# Altium schematic sheet 01_Input_Protection.SchDoc
size 431 x 279 mm; SheetNumber: 1; SheetTotal: 1
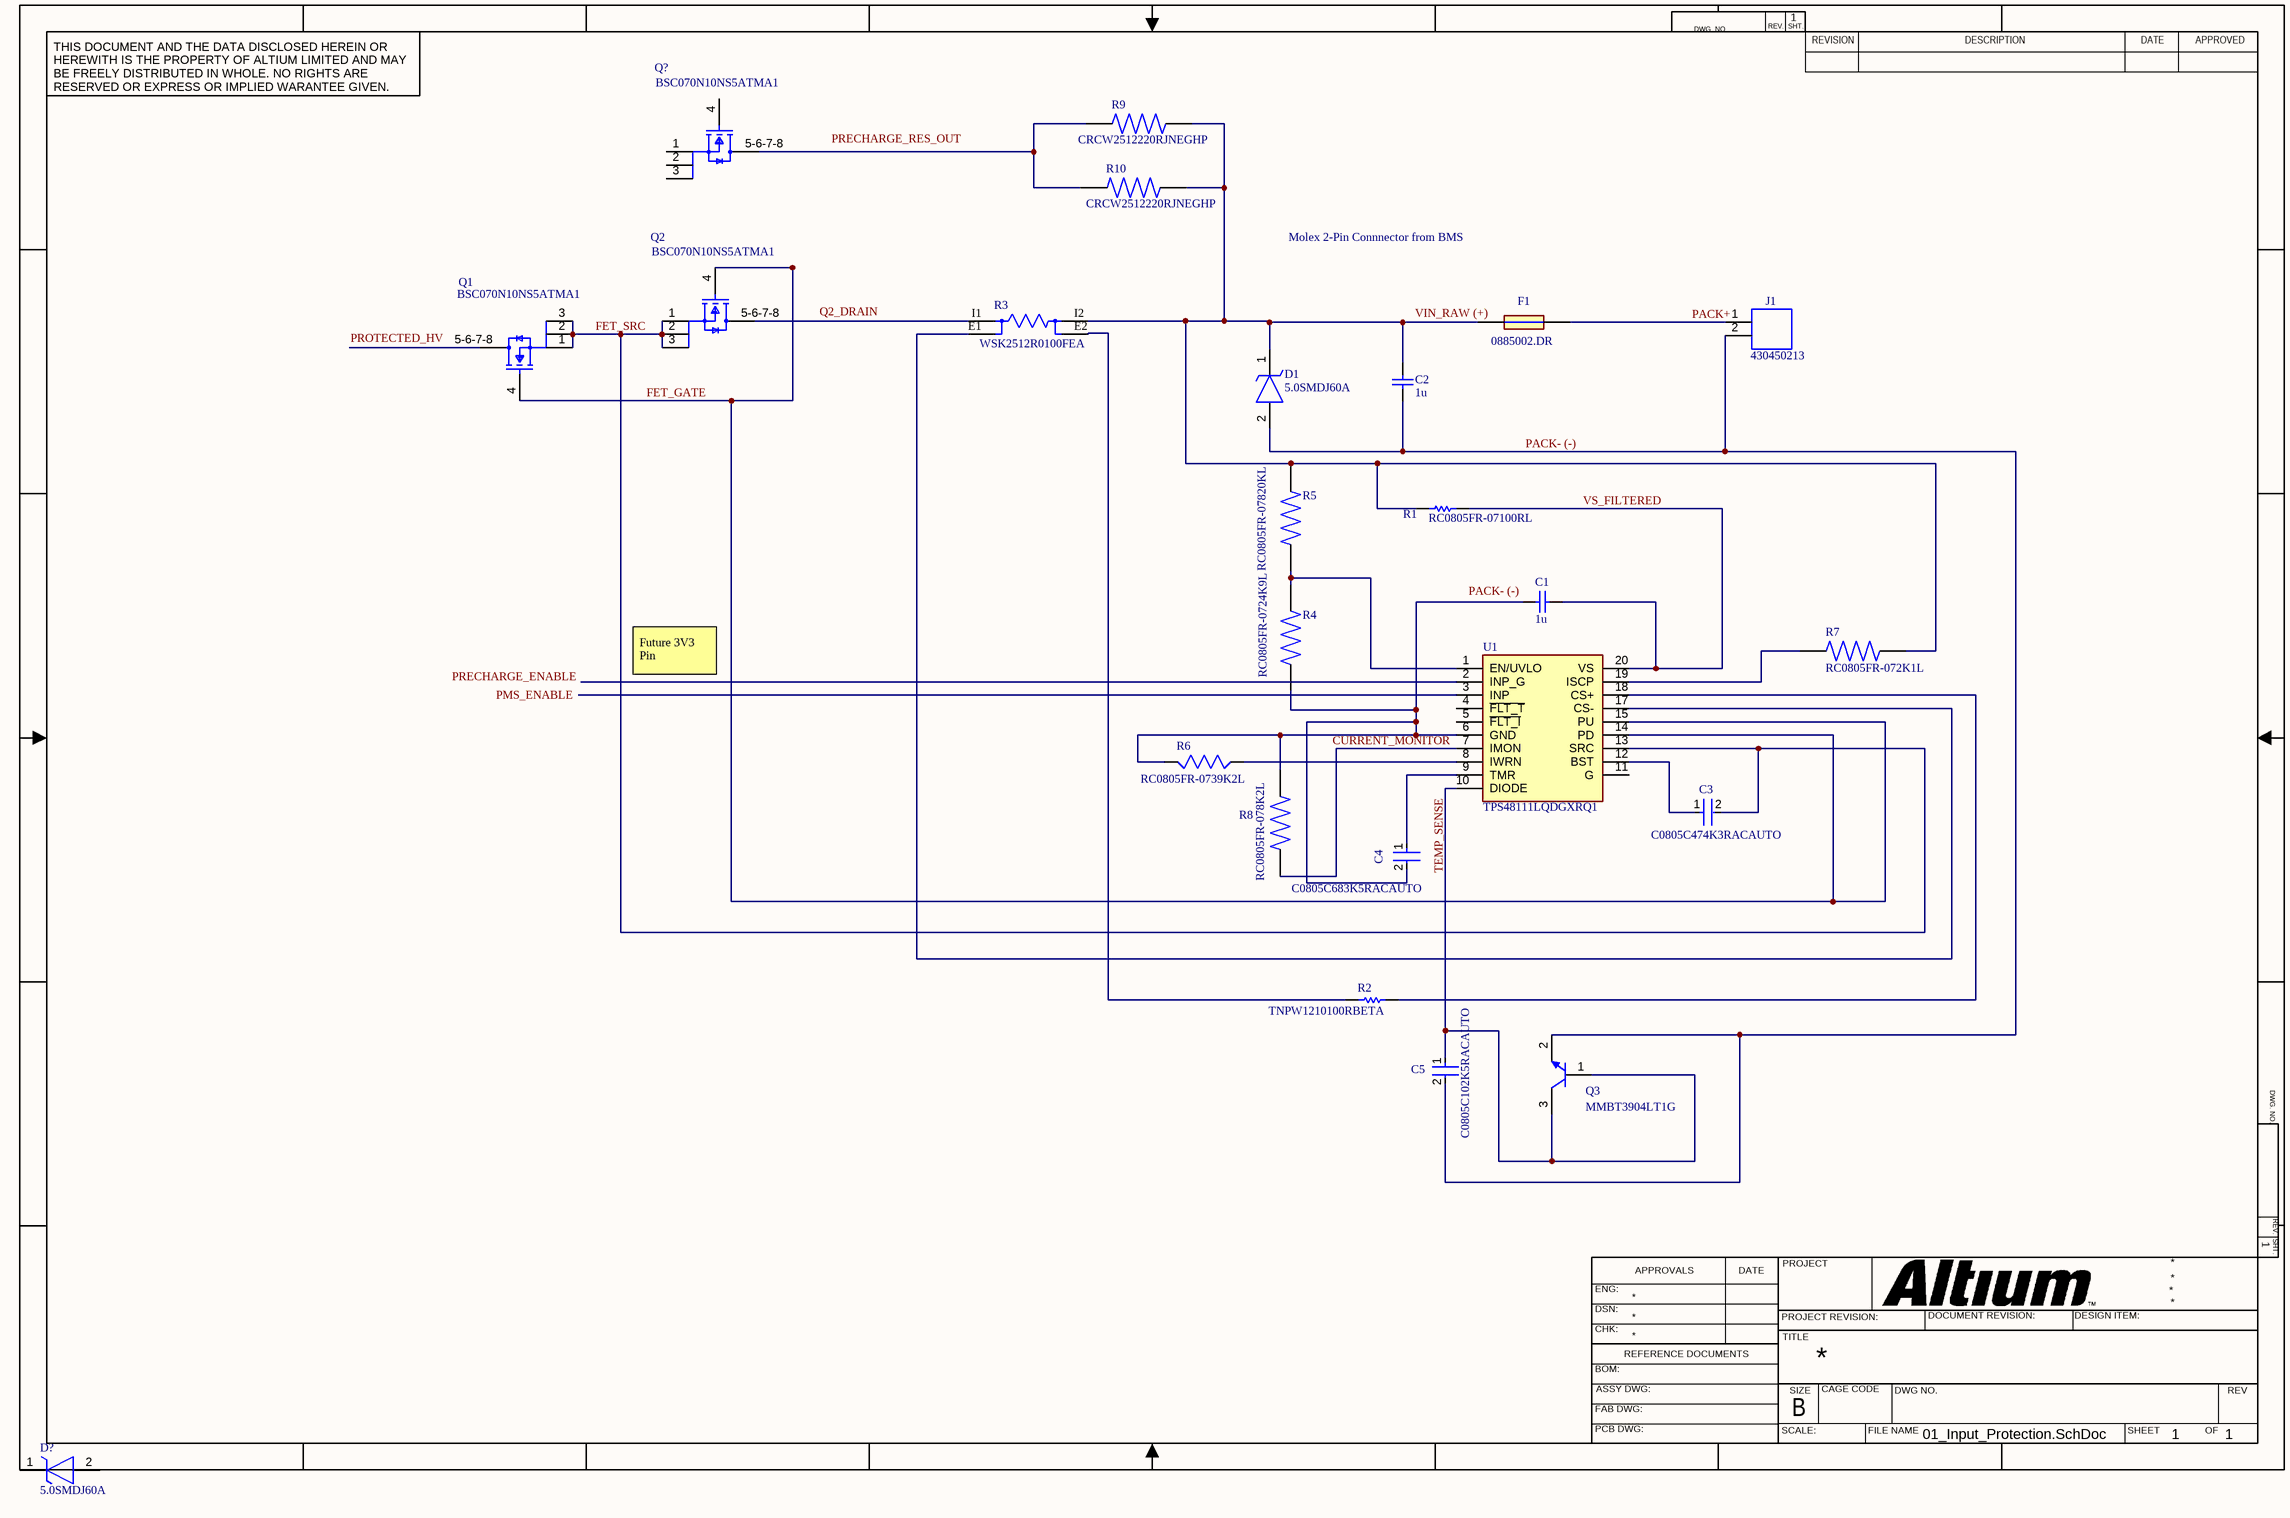
[diagram p0: 01_Input_Protection.SchDoc]

## Parts
C1  value 1u  (hidden comment: Capacitor)
C2  value 1u  (hidden comment: Capacitor)
C3  C0805C474K3RACAUTO  [FP-C0805C-DN-MFG]
C4  C0805C683K5RACAUTO  [FP-C0805C-DN-MFG]
C5  C0805C102K5RACAUTO  [FP-C0805C-DN-MFG]
D1  5.0SMDJ60A  [DIOM7959X262N]
D?  5.0SMDJ60A  [DIOM7959X262N]
F1  0885002.DR  [FUSC10948X488N]
J1  430450213  [CONN_SD-43045-005_02_MOL]
Q1  BSC070N10NS5ATMA1  [FP-PG-TDSON-8-MFG]
Q2  BSC070N10NS5ATMA1  [FP-PG-TDSON-8-MFG]
Q3  MMBT3904LT1G  [ONSC-SOT-23-3-318-08_V]
Q?  BSC070N10NS5ATMA1  [FP-PG-TDSON-8-MFG]
R1  RC0805FR-07100RL  [RESC2013X60X35ML10T20]
R2  TNPW1210100RBETA  [RESC3225X75X50NL15T25]
R3  WSK2512R0100FEA  [FP-WSK2512-1_19-MFG]
R4  RC0805FR-0724K9L  [RESC2012X60N]
R5  RC0805FR-07820KL  [RESC2012X60N]
R6  RC0805FR-0739K2L  [RESC2012X60]
R7  RC0805FR-072K1L  [RESC2012X60N]
R8  RC0805FR-078K2L  [RESC2012X60N]
R9  CRCW2512220RJNEGHP  [RESC6331X70N]
R10  CRCW2512220RJNEGHP  [RESC6331X70N]
U1  TPS48111LQDGXRQ1  [TPS48111LQDGXRQ1]

## Nets
FET_GATE: Q1.4(G) Q2.4(G) U1.14(PD) U1.15(PU)
FET_SRC: C3.2 Q1.1(S) Q1.2(S) Q1.3(S) Q2.1(S) Q2.2(S) Q2.3(S) U1.13(SRC)
PACK+: F1.2 J1.1
PACK- (-): C2.2 C5.2 D1.2(A) J1.2 Q3.2(E)
VS_FILTERED: C1.1 R1.2 U1.20(VS)
NetC1_2: C1.2 C4.2 R4.1 R6.1 R8.2 U1.6(GND)
NetC2_1: C2.1 D1.1(K) F1.1 R1.1 R3.I2 R5.2 R7.2 R9.2 R10.2
NetC3_1: C3.1 U1.12(BST)
NetC4_1: C4.1 U1.9(TMR)
NetC5_1: C5.1 Q3.1(B) Q3.3(C) U1.10(DIODE)
NetQ2_5-6-7-8: Q2.5-6-7-8(D) R3.I1
NetQ?_5-6-7-8: Q?.5-6-7-8(D) R9.1 R10.1
NetR2_1: R2.1 R3.E2
NetR2_2: R2.2 U1.18(CS+)
NetR3_E1: R3.E1 U1.17(CS-)
NetR4_2: R4.2 R5.1 U1.1(EN/UVLO)
NetR6_2: R6.2 U1.8(IWRN)
NetR7_1: R7.1 U1.19(ISCP)
NetR8_1: R8.1 U1.7(IMON)

Not connected (* = marked no-connect by the designer): D? 1(K) 2(A); Q1 5-6-7-8(D); Q? 1(S) 2(S) 3(S) 4(G); U1 2(INP_G) 3(INP) 4(~{FLT_T}) 5(~{FLT_I}) 11(G)

## Notes on the sheet
- Molex 2-Pin Connnector from BMS
- Future 3V3 Pin
- Labels drawn without touching a wire or pin: CURRENT_MONITOR, PACK- (-), PMS_ENABLE, PRECHARGE_ENABLE, PRECHARGE_RES_OUT, PROTECTED_HV, Q2_DRAIN, TEMP_SENSE, VIN_RAW (+)
- DWG. NO.
- REV.
- SHT.
- THIS DOCUMENT AND THE DATA DISCLOSED HEREIN OR HEREWITH IS THE PROPERTY OF ALTIUM LIMITED AND MAY BE FREELY DISTRIBUTED IN WHOLE. NO RIGHTS ARE RESERVED OR EXPRESS OR IMPLIED WARANTEE GIVEN.
- REVISION
- DESCRIPTION
- DATE
- APPROVED
- ENG:
- APPROVALS
- PROJECT
- DSN:
- CHK:
- REFERENCE DOCUMENTS
- PROJECT REVISION:
- TITLE
- DOCUMENT REVISION:
- DESIGN ITEM:
- BOM:
- FAB DWG:
- PCB DWG:
- ASSY DWG:
- SCALE:
- SIZE
- B
- CAGE CODE
- FILE NAME
- DWG NO.
- SHEET
- OF
- REV

## Library data of the parts
C1 C2 = Capacitor: SimulationGenericComponent: True
C3 = CMP-2007-01171-2: CAP CER 0.47UF 25V X7R 0805; Manufacturer: KEMET; Tolerance: 0.1; Material: Ceramic; Value: 0.47 μF; Temperature Coefficient: 30ppm/°C; Device Class L1: Passive Components; Temperature Range Low: -55°C; Digikey Description: CAP CER 0.47UF 25V X7R 0805; Height: 0.88mm; Temperature: -55°C to +125°C; Temperature Characteristic: X7R; Category: Cap; Ipc Land Pattern Name: CAPC200125X78; ComponentLink2URL: https://content.kemet.com/datasheets/KEM_C1003_C0G_SMD.pdf; Lead Free: Yes; Temperature Range High: +125°C; Octopart: https://octopart.com/c0805c474k3racauto-kemet-20068703; Manufacturer Part Number: C0805C474K3RACAUTO; RoHS: TRUE; Package: C0805C-DN; Capacitance: 0.47 μF; Device Class L2: Capacitors; Voltage Rating: 25 V; Automotive: No; Mouser Description: Multilayer Ceramic Capacitors MLCC - SMD/SMT 0.47uF 25volts 10% X7R AUTO; Device Class L3: Ceramic Capacitors; ComponentLink2Description: Datasheet
C4 = CMP-2007-01070-2: CAP CER 0.068UF 50V X7R 0805; Manufacturer: KEMET; Material: Ceramic; Capacitance: 68,000 pF; Value: 68,000 pF; Tolerance: 0.1; Temperature Coefficient: 30ppm/°C; Voltage Rating: 50 V; Temperature Characteristic: X7R; Category: Cap; Automotive: No; ComponentLink2Description: Datasheet; Temperature: -55°C to +125°C; ComponentLink2URL: https://content.kemet.com/datasheets/KEM_C1003_C0G_SMD.pdf; Lead Free: Yes; Octopart: https://octopart.com/c0805c683k5racauto-kemet-12557840; Device Class L3: Ceramic Capacitors; Digikey Description: CAP CER 0.068UF 50V X7R 0805; Ipc Land Pattern Name: CAPC200125X78; Temperature Range Low: -55°C; Device Class L1: Passive Components; Height: 0.88mm; Temperature Range High: +125°C; Device Class L2: Capacitors; Manufacturer Part Number: C0805C683K5RACAUTO; Package: C0805C-DN; RoHS: TRUE
C5 = CMP-2007-00243-2: CAP CER 1000PF 50V X7R 0805; Manufacturer: KEMET; Temperature Coefficient: 30ppm/°C; Description: C0805 1,000 pF X7R 30ppm/°C 10.00% 50 V; Capacitance: 1,000 pF; Value: 1,000 pF; Tolerance: 0.1; Material: Ceramic; Temperature: -55°C to +125°C; Digikey Description: CAP CER 1000PF 50V X7R 0805; Temperature Range Low: -55°C; Package: C0805C-DN; Ipc Land Pattern Name: CAPC200125X78; Manufacturer Part Number: C0805C102K5RACAUTO; ComponentLink2Description: Datasheet; Device Class L3: Ceramic Capacitors; Temperature Range High: +125°C; Category: Cap; Octopart: https://octopart.com/c0805c102k5racauto-kemet-12563740; RoHS: TRUE; Temperature Characteristic: X7R; ComponentLink2URL: https://content.kemet.com/datasheets/KEM_C1003_C0G_SMD.pdf; Device Class L2: Capacitors; Automotive: No; Mouser Description: Cap Ceramic 0.001uF 50V X7R 10% Pad SMD 0805 125C Automotive T/R; Height: 0.88mm; Device Class L1: Passive Components; Lead Free: Yes; Voltage Rating: 50 V
D1 D? = 5.0SMDJ60A: TVS Diode (Uni-directional); Manufacturer_Name: LITTELFUSE; Datasheet Link: https://www.littelfuse.com/media?resourcetype=datasheets&itemid=2b2f4a8c-2e81-4894-8d41-3d748bb79e68&filename=littelfuse-tvs-diode-5-0smdj-datasheet; Height: 2.62mm; Manufacturer_Part_Number: 5.0SMDJ60A; Mouser Part Number: 576-5.0SMDJ60A; Mouser Price/Stock: https://www.mouser.co.uk/ProductDetail/Littelfuse/5.0SMDJ60A?qs=ZSIFh4sPSRrxBM5elXyXAQ%3D%3D; Arrow Part Number: 5.0SMDJ60A; Arrow Price/Stock: https://www.arrow.com/en/products/5-0smdj60a/littelfuse.html?utm_currency=USD&region=asia
F1 = 0885002.DR: FUSE 500V HBC NANO2 PB-FREE 2A; Manufacturer_Name: LITTELFUSE; Geometry.Height: 4.88mm; Manufacturer_Part_Number: 0885002.DR; Mouser Part Number: 576-0885002.DR; Mouser Price/Stock: https://www.mouser.co.uk/ProductDetail/Littelfuse/0885002DR?qs=r5DSvlrkXmJ9HpdhRI%2F6Zg%3D%3D; Arrow Part Number: 0885002.DR; Arrow Price/Stock: https://www.arrow.com/en/products/0885002.dr/littelfuse; Datasheet Link: https://cdn1-originals.webdamdb.com/12956_127233717?cache=1638230044&response-content-disposition=inline;filename=Littelfuse_Fuse_885_Datasheet.pdf&response-content-type=application/pdf&Policy=eyJTdGF0ZW1lbnQiOlt7IlJlc291cmNlIjoiaHR0cCo6Ly9jZG4xLW9yaWdpbm
J1 = 430450213: Connector Header Through Hole 2 position -; MF: Molex; SnapEDA_Link: https://www.snapeda.com/parts/430450213/Molex/view-part/?ref=snap; Package: None; Value: *; MP: 430450213; Check_prices: https://www.snapeda.com/parts/430450213/Molex/view-part/?ref=eda
Q1 Q2 Q? = CMP-32901-000067-1: MOSFET N-CH 100V 80A TDSON-8; Manufacturer: Infineon; Continuous Drain Current: 14A; Threshold Vgs Min: 2.2V; Max Junction Temp: +150°C; Reverse Recovery Charge: 89nC; Depletion Mode: False; Drain To Source Resistance: 6mΩ; Number Of Channels: 1; Threshold Vgs Max: 3.8V; Gate To Source Voltage: 20V; Gate Charge At Vgs: 30nC @ 10V; Pulse Drain Current: 320A; Max Forward Diode Voltage: 1.1V; Power Dissipation: 2.5W; Turn On Delay Time: 13ns; Turn Off Delay Time: 24ns; Reverse Recovery Time: 53ns; Transconductance: 77S; Rthja Max: 50K/W; Input Capacitace At Vds: 2100pF @ 50V; Typ Forward Diode Voltage: 0.9V; Lead Free: Yes; Height: 1.1mm; Category: Trans; Package: PG-TDSON-8; Footprint Url: https://www.infineon.com/cms/en/product/packages/PG-TDSON/PG-TDSON-8-7/; Mouser Description: MOSFET N-Ch 100V 90A TDSON-8; ComponentLink2URL: https://www.infineon.com/dgdl/Infineon-BSC070N10NS5-DS-v02_02-EN.pdf?fileId=5546d4624a0bf290014a0fc62d9d6b3c; Drain To Source Breakdown Voltage: 100V; RoHS: TRUE; ComponentLink2Description: Datasheet; Number Of N Channels: 1; Device Class L2: Transistors; Temperature Range High: +150°C; Device Class L3: MOSFETs; Octopart: https://octopart.com/bsc070n10ns5atma1-infineon-52825714; Temperature Range Low: -55°C; Device Class L1: Discrete Semiconductors; Digikey Description: MOSFET N-CH 100V 80A TDSON-8; Automotive: No; Manufacturer Part Number: BSC070N10NS5ATMA1; Drain To Source Voltage: 100V; Temperature: -55°C to +150°C
Q3 = CMP-1048-00631-1: General Purpose Transistor, NPN Silicon, 3-Pin SOT-23, Pb-Free, Tape and Reel; Manufacturer: On Semiconductor; IC Continuous (A): 0.2; fT Min (MHz): 300; ComponentLink2Description: Datasheet; Polarity: NPN; PackageDescription: 3-Pin Small Outline Transistor, Body 2.92 x 1.3 mm, Pitch 0.95 mm; ComponentLink2URL: http://www.onsemi.cn/pub_link/Collateral/MMBT3904LT1-D.PDF; DatasheetVersion: Rev. 12; Mounting Technology: Surface Mount; PartNumber: MMBT3904LT1G; ComponentLink1URL: http://www.onsemi.com/; ComponentLink3Description: Package Specification; ComponentLink1Description: Manufacturer URL; PackageVersion: Rev. AP, 11/2009; PackageReference: SOT-23-3-318-08; Packing: Tape and Reel; ComponentLink3URL: http://www.onsemi.cn/pub_link/Collateral/318-08.PDF; RoHS: TRUE
R1 = CMP-2100-03669-1: Chip Resistor, 100 Ohm, +/-1%, 0.125 W, -55 to 155 degC, 0805 (2012 Metric), RoHS, Tape and Reel; Manufacturer: Yageo; Power Rating: 125mW; Resistance: 100Ohm; Voltage Rating: 150V; Tolerance: 1%; Temperature Coefficient: 100ppm/degreesC; Length: 2mm; Package Description: 2-Pin Surface Mounted Device, Body 2 x 1.25 mm; Case Code (Imperial): 0805; Number of Pins: 2; Termination: SMD/SMT; Lead Pitch: 0.4mm; Package Quantity: 1; Height: 0.024inch; Case Code (Metric): 2012; Number of Terminations: 2; Datasheet Version: Rev. 5, 10/2016; Lead Free: LeadFree; Package Reference: 0805; Composition: ThickFilm; REACH SVHC: Unknown; Voltage Rating (DC): 150V; Min Operating Temperature: -55degC; Packaging: TapeandReel; Military Standard: Not; Case/Package: 0805; Datasheet URL: http://www.yageo.com/NewPortal/yageodocoutput?fileName=/pdf/R-Chip/PYu-RC_Group_51_RoHS_L_5.pdf; Max Operating Temperature: 155degC; Manufacturer URL: http://www.yageo.com/; Max Power Dissipation: 125mW; Width: 0.049inch; Depth: 1.25mm; RoHSCompliant: true
R2 = CMP-2005-00866-1: Manufacturer: Vishay Dale; Part Number: TNPW1210100RBETA
R3 = CMP-00030-42637745-1: WSK2512R0100FEA SMD Chip Resistor, 10 MOhm, ± 1%, 1 W, 2512 [6332 Metric], Metal Strip, Power; Temperature Coefficient: 35ppm/°C; Voltage Rating (DC): 100mV; Resistance: 10mΩ; Power Rating: 1W; Height: 635µm; REACH SVHC: No SVHC; Weight: 40.511469mg; Composition: Metal Film, Metal Strip; Voltage Rating: 100mV; Contact Plating: Tin; Depth: 3.18mm; Schedule B: 8533210025, 8533210025; NexarPartId: 42637745; Voltage Rating (AC): 100mV; RoHS: Compliant; Termination: SMD/SMT; Length: 6.35mm; Tolerance: 1%; Radiation Hardening: No; Max Operating Temperature: 170°C; Packaging: Cut Tape; Min Operating Temperature: -65°C; Number of Pins: 2; Width: 3.2mm; Case Code (Metric): 6432; Case/Package: 2512; Case Code (Imperial): 2512
R4 = RC0805FR-0724K9L: 24.9 kOhms Â±1% 0.125W, 1/8W Chip Resistor 0805 (2012 Metric) Moisture Resistant Thick Film; MF: Yageo; SnapEDA_Link: https://www.snapeda.com/parts/RC0805FR-0724K9L/Yageo/view-part/?ref=snap; Package: 2012 Yageo; Value: *; MP: RC0805FR-0724K9L; Check_prices: https://www.snapeda.com/parts/RC0805FR-0724K9L/Yageo/view-part/?ref=eda
R5 = RC0805FR-07820KL: 820 kOhms Â±1% 0.125W, 1/8W Chip Resistor 0805 (2012 Metric) Moisture Resistant Thick Film; MF: Yageo; SnapEDA_Link: https://www.snapeda.com/parts/RC0805FR-07820KL/Yageo/view-part/?ref=snap; Package: 2012 Yageo; Value: *; MP: RC0805FR-07820KL; Check_prices: https://www.snapeda.com/parts/RC0805FR-07820KL/Yageo/view-part/?ref=eda
R6 = RC0805FR-0739K2L: 39.2 kOhms Â±1% 0.125W, 1/8W Chip Resistor 0805 (2012 Metric) Moisture Resistant Thick Film; MF: Yageo; SnapEDA_Link: https://www.snapeda.com/parts/RC0805FR-0739K2L/Yageo/view-part/?ref=snap; Package: 2012 Yageo; Value: *; MP: RC0805FR-0739K2L; Check_prices: https://www.snapeda.com/parts/RC0805FR-0739K2L/Yageo/view-part/?ref=eda
R7 = RC0805FR-072K1L: 2.1 kOhms Â±1% 0.125W, 1/8W Chip Resistor 0805 (2012 Metric) Moisture Resistant Thick Film; MF: Yageo; SnapEDA_Link: https://www.snapeda.com/parts/RC0805FR-072K1L/Yageo/view-part/?ref=snap; Package: 2012 Yageo; Value: *; MP: RC0805FR-072K1L; Check_prices: https://www.snapeda.com/parts/RC0805FR-072K1L/Yageo/view-part/?ref=eda
R8 = RC0805FR-078K2L: 8.2 kOhms Â±1% 0.125W, 1/8W Chip Resistor 0805 (2012 Metric) Moisture Resistant Thick Film; MF: Yageo; SnapEDA_Link: https://www.snapeda.com/parts/RC0805FR-078K2L/Yageo/view-part/?ref=snap; Package: 2012 Yageo; Value: *; MP: RC0805FR-078K2L; Check_prices: https://www.snapeda.com/parts/RC0805FR-078K2L/Yageo/view-part/?ref=eda
R9 R10 = CRCW2512220RJNEGHP: 220 Ohms Â±5% 1.5W Chip Resistor 2512 (6432 Metric) Automotive AEC-Q200, Pulse Withstanding Thick Film; MF: Vishay; SnapEDA_Link: https://www.snapeda.com/parts/CRCW2512220RJNEGHP/Vishay/view-part/?ref=snap; Package: 6331 Vishay; Value: *; MP: CRCW2512220RJNEGHP; Check_prices: https://www.snapeda.com/parts/CRCW2512220RJNEGHP/Vishay/view-part/?ref=eda
U1 = TPS48111LQDGXRQ1: TPS4811-Q1 100V Automotive Smart High-Side Driver With Protection and Diagnostics , 3.5V ~ 80V , 4A , 19-VSSOP ,-40C ~ 125C (TA); Manufacturer_Name: Texas Instruments; Geometry.Height: 1.1mm; Manufacturer_Part_Number: TPS48111LQDGXRQ1; Mouser Part Number: 595-TPS48111LQDGXRQ1; Mouser Price/Stock: https://www.mouser.co.uk/ProductDetail/Texas-Instruments/TPS48111LQDGXRQ1?qs=amGC7iS6iy%2Faisrr5sZ5WQ%3D%3D; Arrow Part Number: TPS48111LQDGXRQ1; Arrow Price/Stock: https://www.arrow.com/en/products/tps48111lqdgxrq1/texas-instruments.html?utm_currency=USD&region=nac; Datasheet Link: https://www.ti.com/lit/gpn/tps4811-q1